# Altium project PieZense_Leader.PrjPcb (part 1 of 3)
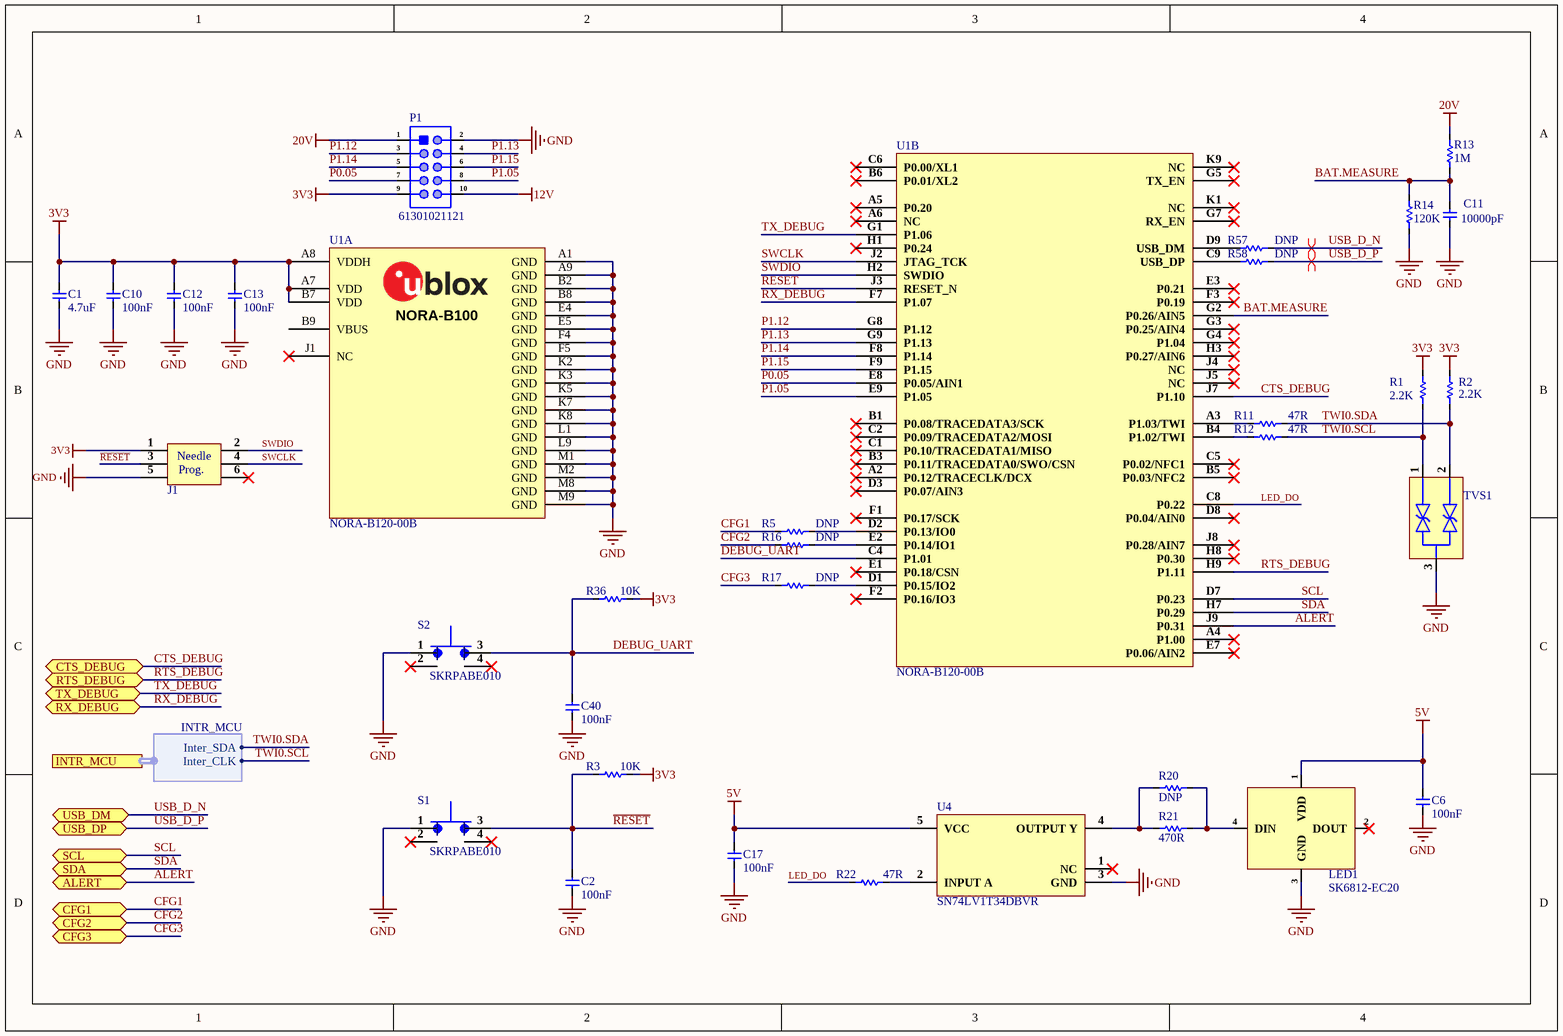
[diagram p0: Piezo_Regulator_Head_MCU.SchDoc]
2 sheets, 136 parts. Net scope: flat (ports and power ports of the same name join across sheets).
Board file: Piezo_Regulator_Head.PcbDoc
Sheets:
  Piezo_Regulator_Head_MCU.SchDoc
  Piezo_Regulator_Head_Power.SchDoc

## Sheet Piezo_Regulator_Head_MCU.SchDoc
size A4; SheetNumber: 1; SheetTotal: 2

### Parts
C1  4.7uF  [Cap-0603]
C2  100nF  [Cap-0603]
C6  100nF  [Cap-0603]
C10  100nF  [Cap-0603]
C11  10000pF  [Cap-0603]
C12  100nF  [Cap-0603]
C13  100nF  [Cap-0603]
C17  100nF  [Cap-0603]
C40  100nF  [Cap-0603]
J1  TC2030-MCP-NL  [TC2030-MCP-NL]  (value not drawn)
LED1  SK6812-EC20  [SK6812-EC20]
P1  61301021121  [HDR 2x5 TH (Male)]
R1  2.2K  [Res-0603]
R2  2.2K  [Res-0603]
R3  10K  [Res-0603]
R5  DNP  [Res-0603]
R11  47R  [Res-0603]
R12  47R  [Res-0603]
R13  1M  [Res-0603]
R14  120K  [Res-0603]
R16  DNP  [Res-0603]
R17  DNP  [Res-0603]
R20  DNP  [Res-0603]
R21  470R  [Res-0603]
R22  47R  [Res-0603]
R36  10K  [Res-0603]
R57  DNP  [Res-0603]
R58  DNP  [Res-0603]
S1  SKRPABE010  [SKRPABE010]
S2  SKRPABE010  [SKRPABE010]
TVS1  NUP2105LT1G  [SOT-23]  (value not drawn)
U1  NORA-B120-00B  [NORA-B120-00B]  (parts A,B of 2)
U4  SN74LV1T34DBVR  [SOT-23-5]

### Ports
ALERT (bidir, see Piezo_Regulator_Head_Power[6D]), CFG1 (bidir, see Piezo_Regulator_Head_Power[6D]), CFG2 (bidir, see Piezo_Regulator_Head_Power[6D]), CFG3 (bidir, see Piezo_Regulator_Head_Power[6D]), CTS_DEBUG (bidir, see Piezo_Regulator_Head_Power[6D]), INTR_MCU (harness INTR_MCU, see Piezo_Regulator_Head_Power[6D]), RTS_DEBUG (bidir, see Piezo_Regulator_Head_Power[6D]), RX_DEBUG (bidir, see Piezo_Regulator_Head_Power[6D]), SCL (bidir, see Piezo_Regulator_Head_Power[6D]), SDA (bidir, see Piezo_Regulator_Head_Power[6D]), TX_DEBUG (bidir, see Piezo_Regulator_Head_Power[6D]), USB_DM (bidir, see Piezo_Regulator_Head_Power[5D]), USB_DP (bidir, see Piezo_Regulator_Head_Power[5D])

### Harnesses
INTR_MCU: Inter_SDA, Inter_CLK

### Nets
3V3: C1.2 C10.2 C12.2 C13.2 J1.1 P1.9 R1.2 R2.2 R3.2 R36.2 U1.A7(VDD) U1.A8(VDDH) U1.B7(VDD)
5V: C6.2 C17.2 LED1.1(VDD) U4.5(VCC)
12V: P1.10
20V: P1.1 R13.2
GND: C1.1 C2.1 C6.1 C10.1 C11.1 C12.1 C13.1 C17.1 C40.1 J1.5 LED1.3(GND) P1.2 R14.1 S1.1 S2.1 TVS1.3 U1.A1(GND) U1.A9(GND) U1.B2(GND) U1.B8(GND) U1.E4(GND) U1.E5(GND) U1.F4(GND) U1.F5(GND) U1.K2(GND) U1.K3(GND) U1.K5(GND) U1.K7(GND) U1.K8(GND) U1.L1(GND) U1.L9(GND) U1.M1(GND) U1.M2(GND) U1.M8(GND) U1.M9(GND) U4.3(GND)
ALERT: U1.J9(P0.31) ; port ALERT
BAT.MEASURE: C11.2 R13.1 R14.2 U1.G2(P0.26/AIN5)
CFG1: R5.1 ; port CFG1
CFG2: R16.1 ; port CFG2
CFG3: R17.1 ; port CFG3
CTS_DEBUG: U1.J7(P1.10) ; port CTS_DEBUG
DEBUG_UART: C40.2 R36.1 S2.3 U1.C4(P1.01)
LED_DO: R22.1 U1.C8(P0.22)
P0.05: P1.7 U1.E8(P0.05/AIN1)
P1.05: P1.8 U1.E9(P1.05)
P1.12: P1.3 U1.G8(P1.12)
P1.13: P1.4 U1.G9(P1.13)
P1.14: P1.5 U1.F8(P1.14)
P1.15: P1.6 U1.F9(P1.15)
~{RESET}: C2.2 J1.3 R3.1 S1.3 U1.J3(RESET_N)
RTS_DEBUG: U1.H9(P1.11) ; port RTS_DEBUG
RX_DEBUG: U1.F7(P1.07) ; port RX_DEBUG
SCL: U1.D7(P0.23) ; port SCL
SDA: U1.H7(P0.29) ; port SDA
SWCLK: J1.4 U1.J2(JTAG_TCK)
SWDIO: J1.2 U1.H2(SWDIO)
TWI0.SCL: R1.1 R12.2 TVS1.1 ; port INTR_MCU.Inter_CLK
TWI0.SDA: R2.1 R11.2 TVS1.2 ; port INTR_MCU.Inter_SDA
TX_DEBUG: U1.G1(P1.06) ; port TX_DEBUG
USB_D_N: R57.2 ; port USB_DM
USB_D_P: R58.2 ; port USB_DP
NetLED1_4: LED1.4(DIN) R20.2 R21.2
NetR5_2: R5.2 U1.D2(P0.13/IO0)
NetR11_1: R11.1 U1.A3(P1.03/TWI)
NetR12_1: R12.1 U1.B4(P1.02/TWI)
NetR16_2: R16.2 U1.E2(P0.14/IO1)
NetR17_2: R17.2 U1.D1(P0.15/IO2)
NetR20_1: R20.1 R21.1 U4.4(OUTPUT_Y)
NetR22_2: R22.2 U4.2(INPUT_A)
NetR57_1: R57.1 U1.D9(USB_DM)
NetR58_1: R58.1 U1.C9(USB_DP)

Not connected (* = marked no-connect by the designer): J1 6*; LED1 2(DOUT)*; S1 2(1)* 4(2)*; S2 2(1)* 4(2)*; U1 A2(P0.12/TRACECLK/DCX)* A4(P1.00)* A5(P0.20)* A6(NC)* B1(P0.08/TRACEDATA3/SCK)* B3(P0.11/TRACEDATA0/SWO/CSN)* B5(P0.03/NFC2)* B6(P0.01/XL2)* B9(VBUS) C1(P0.10/TRACEDATA1/MISO)* C2(P0.09/TRACEDATA2/MOSI)* C5(P0.02/NFC1)* C6(P0.00/XL1)* D3(P0.07/AIN3)* D8(P0.04/AIN0)* E1(P0.18/CSN)* E3(P0.21)* E7(P0.06/AIN2)* F1(P0.17/SCK)* F2(P0.16/IO3)* F3(P0.19)* G3(P0.25/AIN4)* G4(P1.04)* G5(TX_EN)* G7(RX_EN)* H1(P0.24)* H3(P0.27/AIN6)* H8(P0.30)* J1(NC)* J4(NC)* J5(NC)* J8(P0.28/AIN7)* K1(NC)* K9(NC)*; U4 1(NC)*

### Layout directives
differential pair; differential pair class USB_DIF: USB_D_N
differential pair: USB_D_P

### Notes on the sheet
- (in symbol NORA-B120-00B, part A) NORA-B100
- (in symbol TC2030-MCP-NL) Needle; Prog.

### Library data of the parts
C1 = GRM188R6YA475KE15D: CAP CER 4.7UF 35V X5R 0603; Manufacturer: Murata; Manufacturer Lifecycle Status: IN PRODUCTION; Item Type: Capacitors; Value: 4.7µF; Dielectric Material: Ceramic; Tolerance: 10%; Supplier: Arrow Electronics; Supplier Part Number: GRM188R6YA475KE15D; Manufacturer Part Number: GRM188R6YA475KE15D; RoHS: Compliant; Stock: 256000; Pricing: 4000=0.046, 8000=0.039, 24000=0.036 (USD); Case/Package: 0603; Case Code (Imperial): 0603; Case Code (Metric): 1608; Composition: Ceramic; Depth: 800µm; Dielectric: X5R; Height: 800µm; Lead Free: Lead Free; Length: 1.6mm; Lifecycle Status: Production; Material: Ceramic; Max Operating Temperature: 85°C; Min Operating Temperature: -55°C; Mounting Technology: Surface Mount; Number of Terminals: 2; REACH SVHC: Yes; Schedule B: 8532240020, 8532240020|8532240020|8532240020|8532240020|8532240020|8532240020|8532240020|8532240020|8532240020|8532240020|8532240020|8532240020|8532240020|8532240020|8532240020|8532240020|8532240020|8532240020|8532240020|8532240020|8532240020|8532240020|8532240020, 8532240020|8532240020|8532240020|8532240020|8532240020|8532240020|8532240020|8532240020|8532240020|8532240020|8532240020|8532240020|8532240020|8532240020|8532240020|8532240020|8532240020|8532240020|8532240020|8532240020|8532240020|8532240020|8532240020|85; Termination: SMD/SMT; Thickness: 800µm; Voltage: 35V; Voltage Rating: 35V; Voltage Rating (DC): 35V; Weight: 6.293594mg; Width: 800µm; ComponentLink1URL: https://datasheet.octopart.com:443/GRM188R6YA475KE15D-Murata-datasheet-27203393.pdf?src-supplier=Newark; ComponentLink1Description: https://datasheet.octopart.com:443/GRM188R6YA475KE15D-Murata-datasheet-27203393.pdf?src-supplier=Newark; ComponentLink2URL: https://datasheet.octopart.com:443/GRM188R6YA475KE15D-Murata-datasheet-62317201.pdf?src-supplier=element14+APAC; ComponentLink2Description: https://datasheet.octopart.com:443/GRM188R6YA475KE15D-Murata-datasheet-62317201.pdf?src-supplier=element14+APAC; ComponentLink3URL: https://datasheet.octopart.com:443/GRM188R6YA475KE15D-Murata-datasheet-14397410.pdf?src-supplier=Future+Electronics; ComponentLink3Description: https://datasheet.octopart.com:443/GRM188R6YA475KE15D-Murata-datasheet-14397410.pdf?src-supplier=Future+Electronics; ComponentLink4URL: https://datasheet.octopart.com:443/GRM188R6YA475KE15D-Murata-datasheet-165579666.pdf?src-supplier=TME; ComponentLink4Description: https://datasheet.octopart.com:443/GRM188R6YA475KE15D-Murata-datasheet-165579666.pdf?src-supplier=TME; ComponentLink5URL: https://datasheet.octopart.com:443/GRM188R6YA475KE15D-Murata-datasheet-141274968.pdf?src-supplier=Ciiva; ComponentLink5Description: https://datasheet.octopart.com:443/GRM188R6YA475KE15D-Murata-datasheet-141274968.pdf?src-supplier=Ciiva; ComponentLink6URL: https://datasheet.octopart.com:443/GRM188R6YA475KE15D-Murata-datasheet-140705175.pdf?src-supplier=Ciiva; ComponentLink6Description: https://datasheet.octopart.com:443/GRM188R6YA475KE15D-Murata-datasheet-140705175.pdf?src-supplier=Ciiva; ComponentLink7URL: https://datasheet.octopart.com:443/GRM188R6YA475KE15D-Murata-datasheet-138742923.pdf?src-supplier=Ciiva; ComponentLink7Description: https://datasheet.octopart.com:443/GRM188R6YA475KE15D-Murata-datasheet-138742923.pdf?src-supplier=Ciiva; ComponentLink8URL: https://datasheet.octopart.com/GRM188R6YA475KE15D-Murata-datasheet-12515295.pdf; ComponentLink8Description: https://datasheet.octopart.com/GRM188R6YA475KE15D-Murata-datasheet-12515295.pdf; ComponentLink9URL: https://datasheet.octopart.com/GRM188R6YA475KE15D-Murata-datasheet-12510076.pdf; ComponentLink9Description: https://datasheet.octopart.com/GRM188R6YA475KE15D-Murata-datasheet-12510076.pdf; ComponentLink10URL: https://datasheet.octopart.com/GRM188R6YA475KE15D-Murata-datasheet-11978611.pdf; ComponentLink10Description: https://datasheet.octopart.com/GRM188R6YA475KE15D-Murata-datasheet-11978611.pdf; ComponentLink11URL: https://datasheet.octopart.com/GRM188R6YA475KE15D-Murata-datasheet-10025737.pdf; ComponentLink11Description: https://datasheet.octopart.com/GRM188R6YA475KE15D-Murata-datasheet-10025737.pdf; ComponentLink12URL: https://datasheet.octopart.com/GRM188R6YA475KE15D-Murata-datasheet-8819587.pdf; ComponentLink12Description: https://datasheet.octopart.com/GRM188R6YA475KE15D-Murata-datasheet-8819587.pdf; ComponentLink13URL: https://datasheet.octopart.com:443/GRM188R6YA475KE15D-Murata-datasheet-150009168.pdf?src-supplier=Arrow.cn; ComponentLink13Description: https://datasheet.octopart.com:443/GRM188R6YA475KE15D-Murata-datasheet-150009168.pdf?src-supplier=Arrow.cn; ComponentLink14URL: http://sigma.octopart.com:80/reach_statement/Murata-company-16.pdf?src-supplier=Compliance+Statements; ComponentLink14Description: http://sigma.octopart.com:80/reach_statement/Murata-company-16.pdf?src-supplier=Compliance+Statements
C2 C6 C10 C12 C13 C17 C40 = CC0603KRX5R9BB104: CAP CER 0.1UF 50V X5R 0603; Manufacturer: Yageo; Tolerance: 10%; Item Type: Capacitor; Supplier 1: Digi-Key; Manufacturer Part Number: CC0603KRX5R9BB104; RoHS: Yes; Category: Ceramic Capacitors; Stock 1: 152253; Pricing 1: 1=0.10000, 10=0.05200, 50=0.02820, 100=0.02310, 500=0.01648, 1000=0.01294 (USD); Mount: Surface Mount; Case/Package: 0603; Case Code (Imperial): 0603; Case Code (Metric): 1608; Weight: 7.1E-05oz; Min Operating Temperature: -55°C; Max Operating Temperature: 85°C; Capacitance: 100nF; Packaging: Tape and Reel; Voltage Rating: 50V; Dielectric: X5R; Termination: SMD/SMT; Voltage Rating (DC): 50V; Package Quantity: 4000; Length: 0.063inch; Width: 0.031inch; Thickness: 0.035inch; Lead Free: Lead Free; Halogen Free: Halogen Free; ComponentLink1URL: http://www.mouser.com/ds/2/447/Yageo_UPY-GP_NP0_16V-to-50V_9-358835.pdf?src-supplier=Mouser; ComponentLink1Description: http://www.mouser.com/ds/2/447/Yageo_UPY-GP_NP0_16V-to-50V_9-358835.pdf?src-supplier=Mouser; ComponentLink2URL: https://www.yageo.com/upload/media/product/productsearch/datasheet/mlcc/UPY-GPHC_X5R_4V-to-50V_26.pdf?src-supplier=Digi-Key; ComponentLink2Description: https://www.yageo.com/upload/media/product/productsearch/datasheet/mlcc/UPY-GPHC_X5R_4V-to-50V_26.pdf?src-supplier=Digi-Key; ComponentLink3URL: http://www.yageo.com/exep/pages/download/literatures/ProductSelectionGuide%202014_Final_2.pdf?src-supplier=Digi-Key; ComponentLink3Description: http://www.yageo.com/exep/pages/download/literatures/ProductSelectionGuide%202014_Final_2.pdf?src-supplier=Digi-Key; Supplier Part Number 1: 311-4046-1-ND; LCSC Part Number: C110022
C11 = CC0603KRX7R9BB103: CAP CER 10000PF 50V X7R 0603; Manufacturer: Yageo; Material: Ceramic; Tolerance: 10%; Capacitance: 10nF; Insulation Resistance: 100GR; Supplier 1: Digi-Key; Manufacturer Part Number: CC0603KRX7R9BB103; Stock 1: 8411467; Pricing 1: 1=0.1, 10=0.038, 100=0.0171, 500=0.01224, 1000=0.00962 (USD); Mount: Surface Mount; Case/Package: 0603; Number of Pins: 2; Case Code (Metric): 1608; Case Code (Imperial): 0603; Min Operating Temperature: -55°C; Max Operating Temperature: 125°C; Dielectric: X7R; Voltage: 50V; Packaging: Tape and Reel; Voltage Rating: 50V; Voltage Rating (DC): 50V; Package Quantity: 1; Termination: SMD/SMT; Composition: Ceramic; Length: 1.6mm; Height: 0.8mm; Width: 0.031inch; Thickness: 0.035inch; Depth: 0.8mm; Radiation Hardening: No; REACH SVHC: No SVHC; Lead Free: Lead Free; Halogen Free: Halogen Free; ComponentLink1URL: http://www.farnell.com/datasheets/1734573.pdf?src-supplier=Element14; ComponentLink1Description: http://www.farnell.com/datasheets/1734573.pdf?src-supplier=Element14; ComponentLink2URL: http://www.yageo.com/documents/recent/UPY-GPHC_X7R_6.3V-to-50V_18.pdf?src-supplier=Digi-Key; ComponentLink2Description: http://www.yageo.com/documents/recent/UPY-GPHC_X7R_6.3V-to-50V_18.pdf?src-supplier=Digi-Key; ComponentLink3URL: http://www.farnell.com/datasheets/2167236.pdf?src-supplier=Mouser; ComponentLink3Description: http://www.farnell.com/datasheets/2167236.pdf?src-supplier=Mouser; ComponentLink4URL: http://www.farnell.com/datasheets/70765.pdf?src-supplier=Element14; ComponentLink4Description: http://www.farnell.com/datasheets/70765.pdf?src-supplier=Element14; ComponentLink5URL: http://www.yageo.com/documents/recent/UPY-GPHC_X7R_6.3V-to-50V_8.pdf?src-supplier=Avnet+Europe; ComponentLink5Description: http://www.yageo.com/documents/recent/UPY-GPHC_X7R_6.3V-to-50V_8.pdf?src-supplier=Avnet+Europe; ComponentLink6URL: http://www.farnell.com/datasheets/1489800.pdf?src-supplier=Element14; ComponentLink6Description: http://www.farnell.com/datasheets/1489800.pdf?src-supplier=Element14; ComponentLink7URL: https://www.verical.com/server-webapp/html/getDatasheet?partID=403582&src-supplier=Verical; ComponentLink7Description: https://www.verical.com/server-webapp/html/getDatasheet?partID=403582&src-supplier=Verical; Supplier Part Number 1: 311-1085-6-ND; LCSC Part Number: C100042
J1 = TC2030-MCP-NL: PLUG-OF-NAILS 6-PIN W/O LEGS; Manufacturer: Tag-Connect; Item Type: Cables and Wire; Number of Contacts: 6; Shielding: No; Supplier: DigiKey; Supplier Part Number: TC2030-MCP-NLTC-ND; Manufacturer Part Number: TC2030-MCP-NL; RoHS: Compliant; Stock: 740; Pricing: 1=36 (USD); Lead Free: Lead Free; REACH SVHC: No; ComponentLink1URL: https://datasheet.octopart.com:443/TC2030-MCP-NL-Tag-Connect-datasheet-181254555.pdf?src-supplier=IHS; ComponentLink1Description: https://datasheet.octopart.com:443/TC2030-MCP-NL-Tag-Connect-datasheet-181254555.pdf?src-supplier=IHS; ComponentLink2URL: https://datasheet.octopart.com:443/TC2030-MCP-NL-Tag-Connect-datasheet-17049191.pdf?src-supplier=Factory+Futures; ComponentLink2Description: https://datasheet.octopart.com:443/TC2030-MCP-NL-Tag-Connect-datasheet-17049191.pdf?src-supplier=Factory+Futures
LED1 = SK6812-EC20: 5mA -40℃~+80℃ RGB SMD,2x2mm Light Emitting Diodes (LED) ROHS; Manufacturer: OPSCO Optoelectronics; Item Type: RGB LED; Manufacturer Part Number: SK6812-EC20; Package: SMD,2x2mm; LCSC Part Number: C2909058; ComponentLink1Description: LCSC; ComponentLink1URL: https://www.lcsc.com/product-detail/Light-Emitting-Diodes-LED_OPSCO-Optoelectronics-SK6812-EC20_C2909058.html
P1 = 61301021121: CONN HEADER VERT 10POS 2.54MM; Manufacturer: Wurth Elektronik; Item Type: Headers and Wire Housings; Connector Type: Male Pin; Contact Resistance: 20mΩ; Current Rating: 3A; Gender: Male; Insulation: Insulated; Insulation Resistance: 1GΩ; Number of Contacts: 10; Operating Supply Voltage: 250V; Supplier: DigiKey; Supplier Part Number: 732-2672-ND; Manufacturer Part Number: 61301021121; RoHS: Compliant; Stock: 6292; Pricing: 1=1, 10=0.978, 50=0.9028, 100=0.8271, 250=0.75152 (USD); Color: Black; Contact Gender: Male; Contact Material: Gold; Contact Mating Length: 5.9944mm; Contact Plating: Gold; Flammability Rating: UL94 V-0; Height: 8.89mm; Housing Material: PBT; Lead Pitch: 2.54mm; Length: 12.7mm; Max Operating Temperature: 105°C; Min Operating Temperature: -40°C; Mounting Technology: Through Hole; Pins: 10; Number of Positions: 10; Number of Rows: 2; Orientation: Vertical; Packaging: Bulk; Pitch: 2.54mm; Row Spacing: 2.54mm; Termination: Through Hole; Voltage Rating: 250V; Width: 12.7mm; ComponentLink1URL: https://datasheet.octopart.com:443/61301021121-W%C3%BCrth-Elektronik-datasheet-45185731.pdf?src-supplier=Upverter; ComponentLink1Description: https://datasheet.octopart.com:443/61301021121-W%C3%BCrth-Elektronik-datasheet-45185731.pdf?src-supplier=Upverter; ComponentLink2URL: https://datasheet.octopart.com:443/61301021121-W%C3%BCrth-Elektronik-datasheet-149524113.pdf?src-supplier=Future+Electronics; ComponentLink2Description: https://datasheet.octopart.com:443/61301021121-W%C3%BCrth-Elektronik-datasheet-149524113.pdf?src-supplier=Future+Electronics; ComponentLink3URL: https://datasheet.octopart.com:443/61301021121-W%C3%BCrth-Elektronik-Midcom-datasheet-10693404.pdf?src-supplier=element14+APAC; ComponentLink3Description: https://datasheet.octopart.com:443/61301021121-W%C3%BCrth-Elektronik-Midcom-datasheet-10693404.pdf?src-supplier=element14+APAC
R1 R2 = RC0603FR-072K2L: RES 2.2K OHM 1% 1/10W 0603; Manufacturer: Yageo; Resistance: 2.2kR; Temperature Coefficient: 100ppm/°C; Power Rating: 100mW; Voltage Rating: 50V; Item Type: Resistor; Supplier 1: Avnet; Manufacturer Part Number: RC0603FR-072K2L; RoHS: Yes; Category: Chip SMD Resistors; Stock 1: 733100; Pricing 1: 5000=0.00133, 10000=0.00131, 20000=0.00127 (USD); Case/Package: 0603; Case Code (Imperial): 0603; Case Code (Metric): 1608; Size Code: 0603; Min Operating Temperature: -55°C; Max Operating Temperature: 155°C; Tolerance: 1%; Packaging: Tape and Reel; Resistor Type: Thick Film; Package Quantity: 1; Termination: SMD/SMT; Number of Terminations: 2; Max Power Dissipation: 100mW; Features: Moisture Resistant; Series: RC; Resistance Tolerance: 1%; Construction: Rectangular; Length: 1.6mm; Width: 0.031inch; Height: 0.022inch; Depth: 0.8mm; Lead Free: Lead Free; Military Standard: Not; RoHS Compliant: Yes; Supplier Part Number 1: RC0603FR-072K2L; LCSC Part Number: C114662
R3 R36 = RC0603FR-0710KL: RES SMD 10K Ohm 1% 1/10W 0603; Manufacturer: Yageo; Resistance: 10kR; Temperature Coefficient: 100ppm/°C; Voltage Rating (DC): 50V; Power Rating: 100mW; Voltage Rating: 75V; Item Type: Resistor; Supplier 1: Digi-Key; Manufacturer Part Number: RC0603FR-0710KL; RoHS: Yes; Category: Chip SMD Resistors; Stock 1: 25249139; Pricing 1: 1=0.10000, 10=0.02400, 100=0.00970, 1000=0.00436, 2500=0.00378 (USD); Case/Package: 0603; Number of Pins: 2; Case Code (Imperial): 0603; Case Code (Metric): 1608; Weight: 7.1E-05oz; Size Code: 0603; Min Operating Temperature: -55°C; Max Operating Temperature: 155°C; Tolerance: 1%; Resistor Type: Thick Film; Packaging: Tape and Reel; Termination: SMD/SMT; Features: Moisture Resistant; Series: RC; Max Power Dissipation: 100mW; Number of Terminations: 2; Resistance Tolerance: 1%; Construction: Rectangular; Length: 1.6mm; Width: 0.8mm; Height: 0.45mm; Depth: 0.8mm; Lead Pitch: 0.3mm; REACH SVHC: Unknown; Lead Free: Lead Free; Military Standard: Not; RoHS Compliant: Yes; ComponentLink1URL: https://datasheet.ciiva.com/7660/38590-7660789.pdf?src-supplier=Element14; ComponentLink1Description: https://datasheet.ciiva.com/7660/38590-7660789.pdf?src-supplier=Element14; ComponentLink2URL: https://datasheet.ciiva.com/7983/443971-7983596.pdf?src-supplier=Element14; ComponentLink2Description: https://datasheet.ciiva.com/7983/443971-7983596.pdf?src-supplier=Element14; ComponentLink3URL: https://datasheet.ciiva.com/22747/443971-22747519.pdf?src-supplier=Element14; ComponentLink3Description: https://datasheet.ciiva.com/22747/443971-22747519.pdf?src-supplier=Element14; ComponentLink4URL: https://datasheet.ciiva.com/46440/1868787-46440891.pdf?src-supplier=Element14; ComponentLink4Description: https://datasheet.ciiva.com/46440/1868787-46440891.pdf?src-supplier=Element14; ComponentLink5URL: https://datasheet.ciiva.com/7746/1738695-7746239.pdf?src-supplier=Element14; ComponentLink5Description: https://datasheet.ciiva.com/7746/1738695-7746239.pdf?src-supplier=Element14; ComponentLink6URL: https://datasheet.ciiva.com/15189/getdatasheetpartid-409289-15189591.pdf?src-supplier=Verical; ComponentLink6Description: https://datasheet.ciiva.com/15189/getdatasheetpartid-409289-15189591.pdf?src-supplier=Verical; Supplier Part Number 1: 311-10.0KHRCT-ND; LCSC Part Number: C98220
R5 R16 R17 R20 R57 R58 = RC0603JR-070RL: RES 0 OHM JUMPER 1/10W 0603; Manufacturer: Yageo; Resistance: 0mR; Tolerance: 1%; Power Rating: 100mW; Voltage Rating (DC): 50V; Temperature Coefficient: 200ppm/°C; Resistance Tolerance: 5%; Item Type: Resistor; Supplier 1: Digi-Key; Manufacturer Part Number: RC0603JR-070RL; RoHS: Yes; Category: Chip SMD Resistors; Stock 1: 18081776; Pricing 1: 1=0.10000, 10=0.01700, 25=0.01240, 50=0.00960, 100=0.00700, 250=0.00536, 500=0.00430, 1000=0.00316 (USD); Case/Package: 0603; Number of Pins: 2; Contact Plating: Tin,Matte; Case Code (Imperial): 0603; Case Code (Metric): 1608; Size Code: 0603; Min Operating Temperature: -55°C; Max Operating Temperature: 155°C; Resistor Type: Thick Film; Packaging: Tape and Reel; Termination: SMD/SMT; Series: RC; Technology: THICK FILM; Package Quantity: 5000; Voltage Rating: 50V; Features: Moisture Resistant; Max Power Dissipation: 100mW; Number of Terminations: 2; Construction: Rectangular; Length: 1.6mm; Width: 0.8mm; Height: 0.45mm; Depth: 0.8mm; Radiation Hardening: No; Reach SVHC Compliant: No SVHC; Lead Free: Lead Free; RoHS Compliant: Yes; Military Standard: Not; Supplier Part Number 1: 311-0.0GRCT-ND; LCSC Part Number: C95177
R11 R12 R22 = RC0603FR-0747RL: RES SMD 47OHM 0.1W 0603; Manufacturer: Yageo; Tolerance: 1%; Power Rating: 100mW; Voltage Rating (DC): 50V; Temperature Coefficient: 100ppm/°C; Voltage Rating: 75V; Supplier 1: Digi-Key; Manufacturer Part Number: RC0603FR-0747RL; RoHS: Yes; Category: Chip SMD Resistors; Stock 1: 596562; Pricing 1: 1=0.10000, 10=0.02400, 100=0.00970, 1000=0.00436, 2500=0.00378 (USD); Case/Package: 0603; Number of Pins: 2; Case Code (Imperial): 0603; Case Code (Metric): 1608; Weight: 7.1E-05oz; Size Code: 0603; Min Operating Temperature: -55°C; Max Operating Temperature: 155°C; Resistance: 47R; Packaging: Tape and Reel; Package Quantity: 1; Termination: SMD/SMT; Resistor Type: Thick Film; Number of Terminations: 2; Max Power Dissipation: 100mW; Features: Moisture Resistant; Series: RC; Construction: Rectangular; Resistance Tolerance: 1%; Length: 1.6mm; Width: 0.8mm; Height: 0.022inch; Depth: 0.8mm; REACH SVHC: Unknown; Lead Free: Lead Free; Military Standard: Not; RoHS Compliant: Yes; ComponentLink1URL: https://datasheet.ciiva.com/2453/pyu-r-int-thick-7-2453922.pdf?src-supplier=Digi-Key; ComponentLink1Description: https://datasheet.ciiva.com/2453/pyu-r-int-thick-7-2453922.pdf?src-supplier=Digi-Key; ComponentLink2URL: https://datasheet.ciiva.com/2453/pyu-r-int-thick-7-2453923.pdf?src-supplier=Digi-Key; ComponentLink2Description: https://datasheet.ciiva.com/2453/pyu-r-int-thick-7-2453923.pdf?src-supplier=Digi-Key; ComponentLink3URL: https://datasheet.ciiva.com/2453/pyu-r-int-thick-7-2453924.pdf?src-supplier=Digi-Key; ComponentLink3Description: https://datasheet.ciiva.com/2453/pyu-r-int-thick-7-2453924.pdf?src-supplier=Digi-Key; ComponentLink4URL: https://datasheet.ciiva.com/7746/443971-7746363.pdf?src-supplier=Element14; ComponentLink4Description: https://datasheet.ciiva.com/7746/443971-7746363.pdf?src-supplier=Element14; ComponentLink5URL: https://datasheet.ciiva.com/7746/443971-7746364.pdf?src-supplier=Element14; ComponentLink5Description: https://datasheet.ciiva.com/7746/443971-7746364.pdf?src-supplier=Element14; ComponentLink6URL: https://datasheet.ciiva.com/46440/1868787-46440908.pdf?src-supplier=Element14; ComponentLink6Description: https://datasheet.ciiva.com/46440/1868787-46440908.pdf?src-supplier=Element14; Supplier Part Number 1: 311-47.0HRCT-ND; LCSC Part Number: C114623
R13 = RC0603FR-071ML: RES SMD 1M OHM 1% 1/10W 0603; Manufacturer: Yageo; Voltage Rating: 50V; Resistance: 1MR; Power Rating: 100mW; Temperature Coefficient: 100ppm/°C; Item Type: Resistor; Supplier 1: Digi-Key; Manufacturer Part Number: RC0603FR-071ML; Stock 1: 3824601; Pricing 1: 1=0.1, 10=0.023, 100=0.0094, 1000=0.00421, 2500=0.00366 (USD); Case/Package: 0603; Number of Pins: 2; Case Code (Imperial): 0603; Case Code (Metric): 1608; Min Operating Temperature: -55°C; Max Operating Temperature: 155°C; Voltage Rating (DC): 50V; Tolerance: 1%; Packaging: Tape and Reel; Package Quantity: 5000; Termination: SMD/SMT; Composition: Thick Film; Military Standard: Not; Length: 1.6mm; Height: 0.45mm; Width: 0.8mm; Depth: 0.8mm; REACH SVHC: No SVHC; Lead Free: Lead Free; ComponentLink1URL: http://www.farnell.com/datasheets/2167052.pdf?src-supplier=Mouser; ComponentLink1Description: http://www.farnell.com/datasheets/2167052.pdf?src-supplier=Mouser; ComponentLink2URL: http://www.farnell.com/datasheets/2167052.pdf?src-supplier=Element14; ComponentLink2Description: http://www.farnell.com/datasheets/2167052.pdf?src-supplier=Element14; ComponentLink3URL: http://documents.rs-components.com/techlib://itc_doclist_GB.htm?stockno=5048956&src-supplier=RSComponents; ComponentLink3Description: http://documents.rs-components.com/techlib://itc_doclist_GB.htm?stockno=5048956&src-supplier=RSComponents; Supplier Part Number 1: 311-1.00MHRDKR-ND; LCSC Part Number: C105578
R14 = RC0603FR-07120KL: RES 120K OHM 1% 1/10W 0603; Manufacturer: Yageo; Item Type: Resistors; Value: 120kR; Power Rating: 100mW; Voltage Rating: 50V; Temperature Coefficient: 100ppm/°C; Working Voltage: 75V; Supplier: Future Electronics; LCSC Part Number: C114607; Manufacturer Part Number: RC0603FR-07120KL; RoHS: Yes; Stock: 3405000; Pricing: 5000=0.0022, 50000=0.0021, 150000=0.0021, 375000=0.002, 1000000=0.0019 (USD); Case/Package: 0603; Pins: 2; Case Code (Metric): 1608; Case Code (Imperial): 0603; Min Operating Temperature: -55°C; Max Operating Temperature: 155°C; Tolerance: 1%; Resistor Type: Thick Film; Voltage Rating (DC): 50V; Package Quantity: 5000; Packaging: Tape and Reel; Number of Terminations: 2; Termination: SMD/SMT; Max Power Dissipation: 100mW; Features: Moisture Resistant; Series: RC; Resistance Tolerance: 1%; Technology: THICK FILM; Voltage Rating (AC): 50V; Length: 0.063inch; Width: 0.031inch; Height: 0.022inch; Depth: 0.8mm; Lead Pitch: 2.54mm; Radiation Hardening: 5898YesNo; RoHS Compliant: Yes; Reach SVHC Compliant: Unknown; Lead Free: 5697LeadFree; ComponentLink1URL: https://datasheet.ciiva.com/11808/0900766b80f96399-11808757.pdf?src-supplier=Rs; ComponentLink1Description: https://datasheet.ciiva.com/11808/0900766b80f96399-11808757.pdf?src-supplier=Rs; ComponentLink2URL: https://datasheet.ciiva.com/2454/pyu-r-int-thick-7-2454739.pdf?src-supplier=Digikey; ComponentLink2Description: https://datasheet.ciiva.com/2454/pyu-r-int-thick-7-2454739.pdf?src-supplier=Digikey; ComponentLink3URL: https://datasheet.ciiva.com/2454/pyu-r-int-thick-7-2454740.pdf?src-supplier=Digikey; ComponentLink3Description: https://datasheet.ciiva.com/2454/pyu-r-int-thick-7-2454740.pdf?src-supplier=Digikey; ComponentLink4URL: https://datasheet.ciiva.com/2454/pyu-r-int-thick-7-2454738.pdf?src-supplier=Digikey; ComponentLink4Description: https://datasheet.ciiva.com/2454/pyu-r-int-thick-7-2454738.pdf?src-supplier=Digikey; ComponentLink5URL: https://datasheet.ciiva.com/7746/443971-7746247.pdf?src-supplier=Element14; ComponentLink5Description: https://datasheet.ciiva.com/7746/443971-7746247.pdf?src-supplier=Element14; ComponentLink6URL: https://datasheet.ciiva.com/7746/443971-7746246.pdf?src-supplier=Element14; ComponentLink6Description: https://datasheet.ciiva.com/7746/443971-7746246.pdf?src-supplier=Element14
R21 = RC0603FR-07470RL: RES 470 OHM 1% 1/10W 0603; Manufacturer: Yageo; Power Rating: 100mW; Voltage Rating: 50V; Temperature Coefficient: 100ppm/°C; Working Voltage: 75V; Supplier 1: Digi-Key; Manufacturer Part Number: RC0603FR-07470RL; RoHS: Yes; Category: Chip SMD Resistors; Stock 1: 154083; Pricing 1: 1=0.10000, 10=0.02400, 100=0.00970, 1000=0.00436, 2500=0.00378 (USD); Case/Package: 0603; Case Code (Metric): 1608; Case Code (Imperial): 0603; Min Operating Temperature: -55°C; Max Operating Temperature: 155°C; Tolerance: 1%; Resistance: 470R; Packaging: Tape and Reel; Package Quantity: 1; Resistor Type: Thick Film; Number of Terminations: 2; Termination: SMD/SMT; Max Power Dissipation: 100mW; Features: Moisture Resistant; Series: RC; Technology: THICK FILM; Resistance Tolerance: 1%; Construction: Rectangular; Length: 1.6mm; Width: 0.031inch; Height: 0.022inch; Depth: 0.8mm; RoHS Compliant: Yes; REACH SVHC: No SVHC; Military Standard: Not; Lead Free: Lead Free; ComponentLink1URL: https://datasheet.ciiva.com/11808/0900766b80f96399-11808177.pdf?src-supplier=RSComponents; ComponentLink1Description: https://datasheet.ciiva.com/11808/0900766b80f96399-11808177.pdf?src-supplier=RSComponents; ComponentLink2URL: https://datasheet.ciiva.com/7746/1738695-7746359.pdf?src-supplier=Element14; ComponentLink2Description: https://datasheet.ciiva.com/7746/1738695-7746359.pdf?src-supplier=Element14; ComponentLink3URL: https://datasheet.ciiva.com/7746/1738695-7746360.pdf?src-supplier=Element14; ComponentLink3Description: https://datasheet.ciiva.com/7746/1738695-7746360.pdf?src-supplier=Element14; ComponentLink4URL: https://datasheet.ciiva.com/7660/1868787-7660793.pdf?src-supplier=Element14; ComponentLink4Description: https://datasheet.ciiva.com/7660/1868787-7660793.pdf?src-supplier=Element14; ComponentLink5URL: https://datasheet.ciiva.com/46440/1868787-46440907.pdf?src-supplier=Element14; ComponentLink5Description: https://datasheet.ciiva.com/46440/1868787-46440907.pdf?src-supplier=Element14; ComponentLink6URL: https://datasheet.ciiva.com/2454/pyu-r-int-thick-7-2454012.pdf?src-supplier=Digi-Key; ComponentLink6Description: https://datasheet.ciiva.com/2454/pyu-r-int-thick-7-2454012.pdf?src-supplier=Digi-Key; ComponentLink7URL: https://datasheet.ciiva.com/2454/pyu-r-int-thick-7-2454013.pdf?src-supplier=Digi-Key; ComponentLink7Description: https://datasheet.ciiva.com/2454/pyu-r-int-thick-7-2454013.pdf?src-supplier=Digi-Key; ComponentLink8URL: https://datasheet.ciiva.com/2454/pyu-r-int-thick-7-2454014.pdf?src-supplier=Digi-Key; ComponentLink8Description: https://datasheet.ciiva.com/2454/pyu-r-int-thick-7-2454014.pdf?src-supplier=Digi-Key; Supplier Part Number 1: 311-470HRCT-ND; LCSC Part Number: C114669
S1 S2 = SKRPABE010: SWITCH TACTILE SPST-NO 0.05A 16V; Manufacturer: ALPS; Item Type: Tactile Switches; Actuator Length: 711.2µm; Contact Current Rating: 50mA; Contact Resistance: 500mΩ; Electrical Life: 100kcycles; Insulation Resistance: 100MΩ; Number of Positions: 1; Operating Force: 1.57N; Throw Configuration: SPST; Supplier: DigiKey; Supplier Part Number: 4809-SKRPABE010CT-ND; Manufacturer Part Number: SKRPABE010; RoHS: Compliant; Stock: 35807; Pricing: 1=0.21, 10=0.179, 25=0.1684, 100=0.1511, 250=0.14016, 500=0.13228, 1000=0.12484 (USD); Case/Package: SMD/SMT; Color: Clear; Contact Plating: Silver; Current Rating: 50mA; Depth: 4.6mm; Height: 1.8034mm; Lead Free: Lead Free; Length: 4.191mm; Life (Cycles): 100kcycles; Lifecycle Status: Production; Max Current Rating: 50mA; Max Operating Temperature: 85°C; Max Voltage Rating (DC): 16V; Min Operating Temperature: -30°C; Mounting Technology: Surface Mount; Orientation: Straight; Radiation Hardening: No; Termination: J-Bend; Voltage Rating (DC): 16V; ComponentLink1URL: https://datasheet.octopart.com:443/SKRPABE010-ALPS-datasheet-182234810.pdf?src-supplier=IHS; ComponentLink1Description: https://datasheet.octopart.com:443/SKRPABE010-ALPS-datasheet-182234810.pdf?src-supplier=IHS; ComponentLink2URL: https://datasheet.octopart.com:443/SKRPABE010-ALPS-datasheet-182235266.pdf?src-supplier=IHS; ComponentLink2Description: https://datasheet.octopart.com:443/SKRPABE010-ALPS-datasheet-182235266.pdf?src-supplier=IHS; ComponentLink3URL: https://datasheet.octopart.com:443/SKRPABE010-ALPS-datasheet-41327040.pdf?src-supplier=Master+Electronics; ComponentLink3Description: https://datasheet.octopart.com:443/SKRPABE010-ALPS-datasheet-41327040.pdf?src-supplier=Master+Electronics; ComponentLink4URL: https://datasheet.octopart.com:443/SKRPABE010-ALPS-datasheet-138899521.pdf?src-supplier=TME; ComponentLink4Description: https://datasheet.octopart.com:443/SKRPABE010-ALPS-datasheet-138899521.pdf?src-supplier=TME; ComponentLink5URL: https://datasheet.octopart.com:443/SKRPABE010-ALPS-datasheet-37145204.pdf?src-supplier=Electro+Sonic; ComponentLink5Description: https://datasheet.octopart.com:443/SKRPABE010-ALPS-datasheet-37145204.pdf?src-supplier=Electro+Sonic
TVS1 = NUP2105LT1G: TVS DIODE 24VWM 44VC SOT233; Manufacturer: onsemi; Manufacturer Lifecycle Status: ACTIVE; Item Type: TVS Diodes; Breakdown Voltage: 29.1V; Value: 30pF; Clamping Voltage: 44V; Direction: Bidirectional; Element Configuration: Dual; ESD Protection: Yes; Leakage Current: 100nA; Max Breakdown Voltage: 32V; Max Power Dissipation: 350W; Max Surge Current: 8A; Min Breakdown Voltage: 26.2V; Number of Bidirectional Channels: 2; Operating Supply Voltage: 24V; Power Line Protection: No; Test Current: 1mA; Supplier: Arrow Electronics; LCSC Part Number: C14486; Manufacturer Part Number: NUP2105LT1G; RoHS: Compliant; Stock: 2046000; Pricing: 3000=0.0671 (USD); Case/Package: SOT-23; China RoHS: Compliant; Composition: Zener; Contact Plating: Tin; Depth: 1.3mm; Halogen Free: Halogen Free; Height: 940µm; Lead Free: Lead Free; Length: 2.9mm; Lifecycle Status: Production; Max Operating Temperature: 150°C; Max Reverse Leakage Current: 100nA; Min Operating Temperature: -55°C; Number of Channels: 2; Number of Elements: 2; Number of Lines: 2; Pins: 3; Number of Terminals: 3; Packaging: Tape and Reel; Peak Pulse Current: 8A; Peak Pulse Power: 350W; Peak Reverse Current: 100nA; Polarity: Bidirectional; Radiation Hardening: No; REACH SVHC: Yes; Reverse Standoff Voltage: 24V; Termination: SMD/SMT; Width: 1.3mm; Working Voltage: 24V; ComponentLink1URL: https://datasheet.octopart.com:443/NUP2105LT1G-onsemi-datasheet-180968600.pdf?src-supplier=IHS; ComponentLink1Description: https://datasheet.octopart.com:443/NUP2105LT1G-onsemi-datasheet-180968600.pdf?src-supplier=IHS; ComponentLink2URL: https://datasheet.octopart.com:443/NUP2105LT1G-ON-Semiconductor-datasheet-141916699.pdf?src-supplier=Upverter; ComponentLink2Description: https://datasheet.octopart.com:443/NUP2105LT1G-ON-Semiconductor-datasheet-141916699.pdf?src-supplier=Upverter; ComponentLink3URL: https://datasheet.octopart.com:443/NUP2105LT1G-ON-Semiconductor-datasheet-138898254.pdf?src-supplier=onsemi; ComponentLink3Description: https://datasheet.octopart.com:443/NUP2105LT1G-ON-Semiconductor-datasheet-138898254.pdf?src-supplier=onsemi; ComponentLink4URL: https://datasheet.octopart.com:443/NUP2105LT1G-ON-Semiconductor-datasheet-8329749.pdf?src-supplier=element14+APAC; ComponentLink4Description: https://datasheet.octopart.com:443/NUP2105LT1G-ON-Semiconductor-datasheet-8329749.pdf?src-supplier=element14+APAC; ComponentLink5URL: https://datasheet.octopart.com:443/NUP2105LT1G-onsemi-datasheet-163746571.pdf?src-supplier=element14+APAC; ComponentLink5Description: https://datasheet.octopart.com:443/NUP2105LT1G-onsemi-datasheet-163746571.pdf?src-supplier=element14+APAC; ComponentLink6URL: https://datasheet.octopart.com:443/NUP2105LT1G-ON-Semiconductor-datasheet-62289975.pdf?src-supplier=RS+(Formerly+Allied+Electronics); ComponentLink6Description: https://datasheet.octopart.com:443/NUP2105LT1G-ON-Semiconductor-datasheet-62289975.pdf?src-supplier=RS+(Formerly+Allied+Electronics); ComponentLink7URL: https://datasheet.octopart.com:443/NUP2105LT1G-ON-Semiconductor-datasheet-10979798.pdf?src-supplier=TME; ComponentLink7Description: https://datasheet.octopart.com:443/NUP2105LT1G-ON-Semiconductor-datasheet-10979798.pdf?src-supplier=TME; ComponentLink8URL: https://datasheet.octopart.com:443/NUP2105LT1G-onsemi-datasheet-157205202.pdf?src-supplier=TME; ComponentLink8Description: https://datasheet.octopart.com:443/NUP2105LT1G-onsemi-datasheet-157205202.pdf?src-supplier=TME; ComponentLink9URL: https://datasheet.octopart.com:443/NUP2105LT1G-onsemi-datasheet-38906.pdf?src-supplier=Master+Electronics; ComponentLink9Description: https://datasheet.octopart.com:443/NUP2105LT1G-onsemi-datasheet-38906.pdf?src-supplier=Master+Electronics; ComponentLink10URL: https://datasheet.octopart.com:443/NUP2105LT1G.-ON-Semiconductor-datasheet-94100686.pdf?src-supplier=Newark; ComponentLink10Description: https://datasheet.octopart.com:443/NUP2105LT1G.-ON-Semiconductor-datasheet-94100686.pdf?src-supplier=Newark; ComponentLink11URL: https://datasheet.octopart.com:443/NUP2105LT1G-ON-Semiconductor-datasheet-14047665.pdf?src-supplier=iiiC; ComponentLink11Description: https://datasheet.octopart.com:443/NUP2105LT1G-ON-Semiconductor-datasheet-14047665.pdf?src-supplier=iiiC; ComponentLink12URL: http://sigma.octopart.com:80/15540786/rohs_certificate/ON-Semiconductor-NUP2105LT1G.pdf?src-supplier=Compliance+Statements; ComponentLink12Description: http://sigma.octopart.com:80/15540786/rohs_certificate/ON-Semiconductor-NUP2105LT1G.pdf?src-supplier=Compliance+Statements; ComponentLink13URL: http://sigma.octopart.com:80/15684253/materials_sheet/ON-Semiconductor-NUP2105LT1G.csv?src-supplier=Compliance+Statements; ComponentLink13Description: http://sigma.octopart.com:80/15684253/materials_sheet/ON-Semiconductor-NUP2105LT1G.csv?src-supplier=Compliance+Statements; ComponentLink14URL: http://sigma.octopart.com:80/150629775/rohs_statement/ON-Semiconductor-NUP2105LT1G.pdf?src-supplier=Compliance+Statements; ComponentLink14Description: http://sigma.octopart.com:80/150629775/rohs_statement/ON-Semiconductor-NUP2105LT1G.pdf?src-supplier=Compliance+Statements; ComponentLink15URL: http://sigma.octopart.com:80/reach_statement/ON-Semiconductor-company-79.pdf?src-supplier=Compliance+Statements; ComponentLink15Description: http://sigma.octopart.com:80/reach_statement/ON-Semiconductor-company-79.pdf?src-supplier=Compliance+Statements; ComponentLink16URL: https://octopart.com:443/opatz8j6/c1?t=ZMQXRxl-tlOkTyCYWhiMSP0LPI36EMzxCu-rt4xVRkID6w1lkEqxXgfbyVHAv14EjzJQpMVrLm_GTNZmohIwKCbSQuhxgS4aaCOzuMZuzdtTNQjpOCOkObyoWTwnGitjD_aKANRAh2lPw-KtIiSN1C9a6qccJDCVrU3OyukjJjMVpNxQPGMvXs50OIMOtkcrM5shLr84_QV0TpV-tx49makq4PEa-F8ImDZxhjRMek526FA-FcjWLTSpNIusNfqu_3SnxPi4ucx5Ny24zrervKXbTtAk3aU33KfwhMqxTE9mwBLbd5ol23c2I0SDhKArEjQYMqXQ2s8XiDN6A3kYu5cM-5e4RY3v1HohIOej&src-supplier=Compliance+Statements; ComponentLink16Description: https://octopart.com:443/opatz8j6/c1?t=ZMQXRxl-tlOkTyCYWhiMSP0LPI36EMzxCu-rt4xVRkID6w1lkEqxXgfbyVHAv14EjzJQpMVrLm_GTNZmohIwKCbSQuhxgS4aaCOzuMZuzdtTNQjpOCOkObyoWTwnGitjD_aKANRAh2lPw-KtIiSN1C9a6qccJDCVrU3OyukjJjMVpNxQPGMvXs50OIMOtkcrM5shLr84_QV0TpV-tx49makq4PEa-F8ImDZxhjRMek526FA-FcjWLTSpNIusNfqu_3SnxPi4ucx5Ny24zrervKXbTtAk3aU33KfwhMqxTE9mwBLbd5ol23c2I0SDhKArEjQYMqXQ2s8XiDN6A3kYu5cM-5e4RY3v1HohIOej&src-supplier=Compliance+Statements; ComponentLink17URL: https://octopart.com:443/opatz8j6/c1?t=YAOrV0sMfXqVKWiE8k6dH1WclSlXB8gtlFWIwd4S7cYIeFCwgkBwbQJ5bWgsFHDi1PC-Qpb_Ct26CUG4UP-SQd806vdedNOA1AZ0mSUejaT1W15FwcKfZSqKtOg6OcLIZhGfUMXc4tA2cbQkgpIhx2KL7fZwcWhjVKDmOvUiltx43fdyMtIeSqzWtG30gLqCacBQFQmUjDNp97EetbhDXMa2NNxkO77MiJ1iJWdcIgpl2SLRAqm79JYpxIDHGLW2aimYKGEaixugE9-YzaQRB_J1_LvMpaZzYYa86eJBg1j47JCsO_PKNIbsx3s0tfo-1v4YqdsprCQBLNtzKj_wzUXjJuCrJvlRKr5GCqo&src-supplier=Compliance+Statements; ComponentLink17Description: https://octopart.com:443/opatz8j6/c1?t=YAOrV0sMfXqVKWiE8k6dH1WclSlXB8gtlFWIwd4S7cYIeFCwgkBwbQJ5bWgsFHDi1PC-Qpb_Ct26CUG4UP-SQd806vdedNOA1AZ0mSUejaT1W15FwcKfZSqKtOg6OcLIZhGfUMXc4tA2cbQkgpIhx2KL7fZwcWhjVKDmOvUiltx43fdyMtIeSqzWtG30gLqCacBQFQmUjDNp97EetbhDXMa2NNxkO77MiJ1iJWdcIgpl2SLRAqm79JYpxIDHGLW2aimYKGEaixugE9-YzaQRB_J1_LvMpaZzYYa86eJBg1j47JCsO_PKNIbsx3s0tfo-1v4YqdsprCQBLNtzKj_wzUXjJuCrJvlRKr5GCqo&src-supplier=Compliance+Statements
U1 = NORA-B120-00B: RF TXRX MOD BT /ANTU.FL SMD; Manufacturer: u-blox; Item Type: Module; Max Supply Voltage: 3.6V; Min Supply Voltage: 1.7V; Operating Supply Voltage: 3.3V; Supplier: Avnet; Supplier Part Number: NORA-B120-00B; Manufacturer Part Number: NORA-B120-00B; RoHS: Compliant; Stock: 500; Pricing: 500=11.22667, 1000=11.00654, 2000=10.85052, 4000=10.69886, 8000=10.525 (USD); Height - Seated (Max): 1.9mm; Length: 14.3mm; Lifecycle Status: Production; Max Operating Temperature: 105°C; Min Operating Temperature: -40°C; Number of Terminals: 82; Terminal Pitch: 1.1mm; Width: 10.4mm; ComponentLink1URL: https://datasheet.octopart.com:443/NORA-B120-00B-u-blox-datasheet-175595538.pdf?src-supplier=IHS; ComponentLink1Description: https://datasheet.octopart.com:443/NORA-B120-00B-u-blox-datasheet-175595538.pdf?src-supplier=IHS; ComponentLink2URL: https://datasheet.octopart.com:443/NORA-B120-00B-u-blox-datasheet-166811452.pdf?src-supplier=TME; ComponentLink2Description: https://datasheet.octopart.com:443/NORA-B120-00B-u-blox-datasheet-166811452.pdf?src-supplier=TME; ComponentLink3URL: https://datasheet.octopart.com:443/NORA-B120-00B-u-blox-datasheet-166532002.pdf?src-supplier=TME; ComponentLink3Description: https://datasheet.octopart.com:443/NORA-B120-00B-u-blox-datasheet-166532002.pdf?src-supplier=TME
U4 = SN74LV1T34DBVR: IC BUF NON-INVERT 5.5V SOT23-5; Manufacturer: Texas Instruments; Number of Elements: 1; Logic Function: Buffer,Inverting; High Level Output Current: -8mA; Low Level Output Current: 8mA; Min Supply Voltage: 1.6V; Polarity: Non-Inverting; Propagation Delay: 15.5ns; Quiescent Current: 1uA; Supplier 1: Digi-Key; Manufacturer Part Number: SN74LV1T34DBVR; Stock 1: 37360; Pricing 1: 1=0.43, 10=0.349, 25=0.3192, 100=0.2374, 250=0.2152, 500=0.17808, 1000=0.13356 (USD); Mount: Surface Mount; Case/Package: SOT-23-5; Number of Pins: 5; Weight: 0.000353oz; Min Operating Temperature: -40°C; Max Operating Temperature: 125°C; Packaging: Tape and Reel; Number of Bits per Element: 1; Number of Bits: 1; Package Quantity: 3000; Max Supply Voltage: 5.5V; Number of Input Lines: 1; Number of Output Lines: 1; Operating Supply Current: 8mA; Number of Channels: 1; Number of Inputs: 1; Number of Outputs: 1; Radiation Hardening: No; RoHS Compliant: Yes; REACH SVHC: No SVHC; Lead Free: Lead Free; ComponentLink1URL: http://www.ti.com/lit/pdf/sdyu001?src-supplier=Digi-Key; ComponentLink1Description: http://www.ti.com/lit/pdf/sdyu001?src-supplier=Digi-Key; ComponentLink2URL: http://www.ti.com/lit/ds/symlink/sn74lv1t34.pdf?src-supplier=Avnet; ComponentLink2Description: http://www.ti.com/lit/ds/symlink/sn74lv1t34.pdf?src-supplier=Avnet; Supplier Part Number 1: 296-37176-6-ND; LCSC Part Number: C100024; Item Type: IC

## Sheet Piezo_Regulator_Head_Power.SchDoc
size A2; SheetNumber: 2; SheetTotal: 2
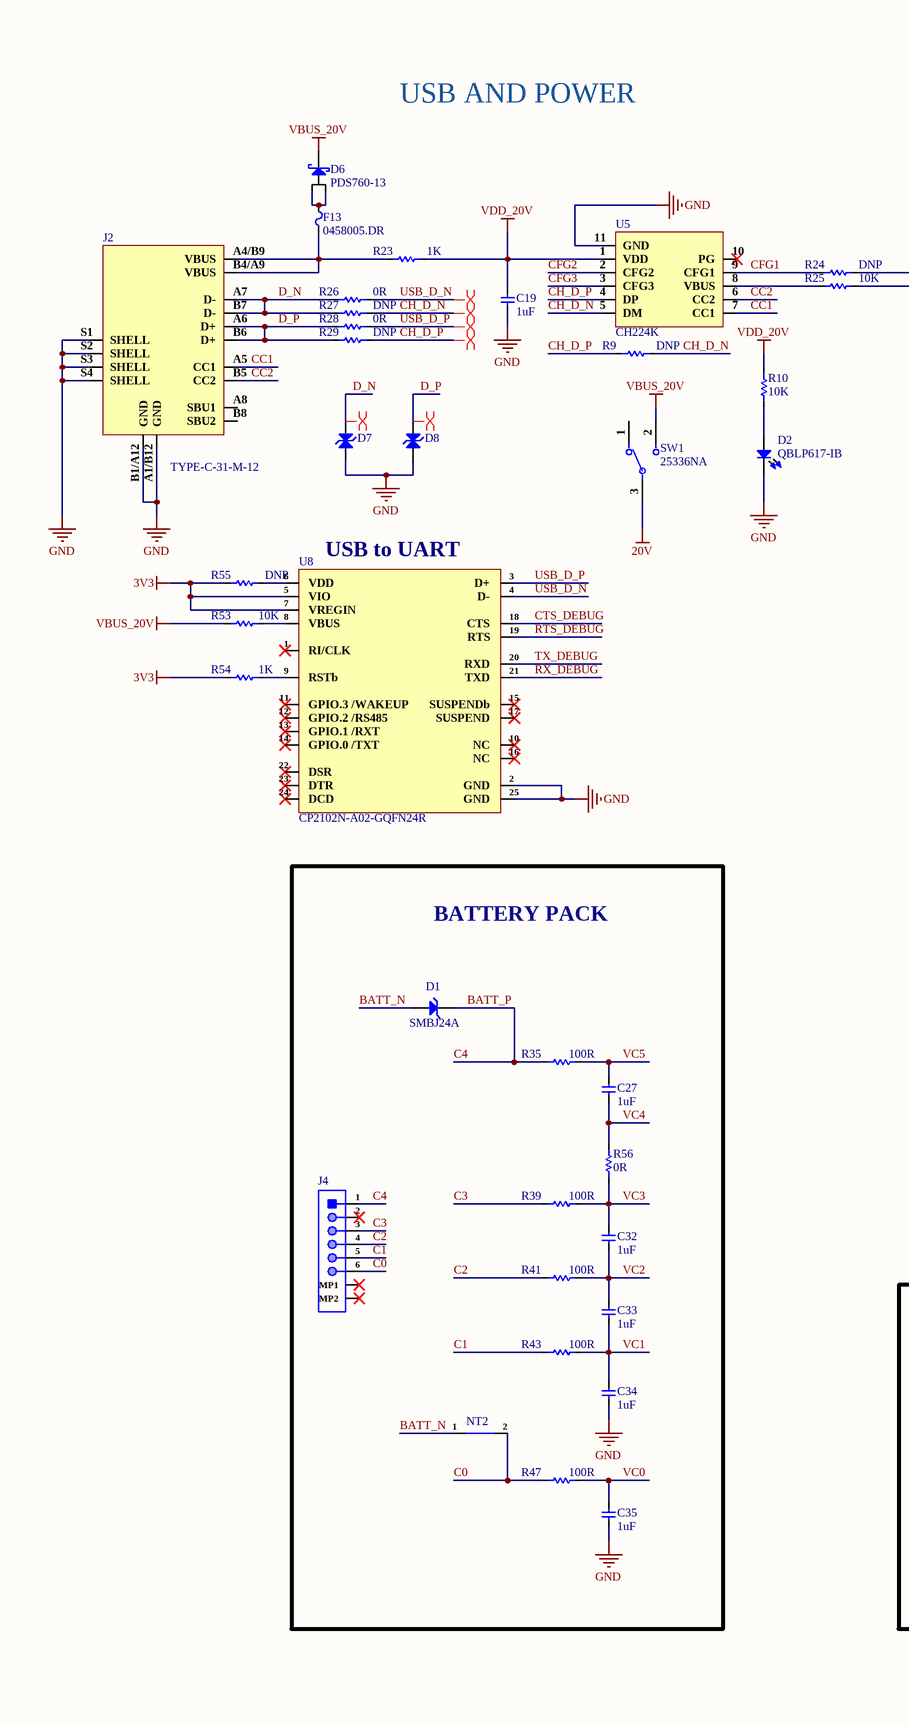
[diagram p1: Piezo_Regulator_Head_Power.SchDoc, left]
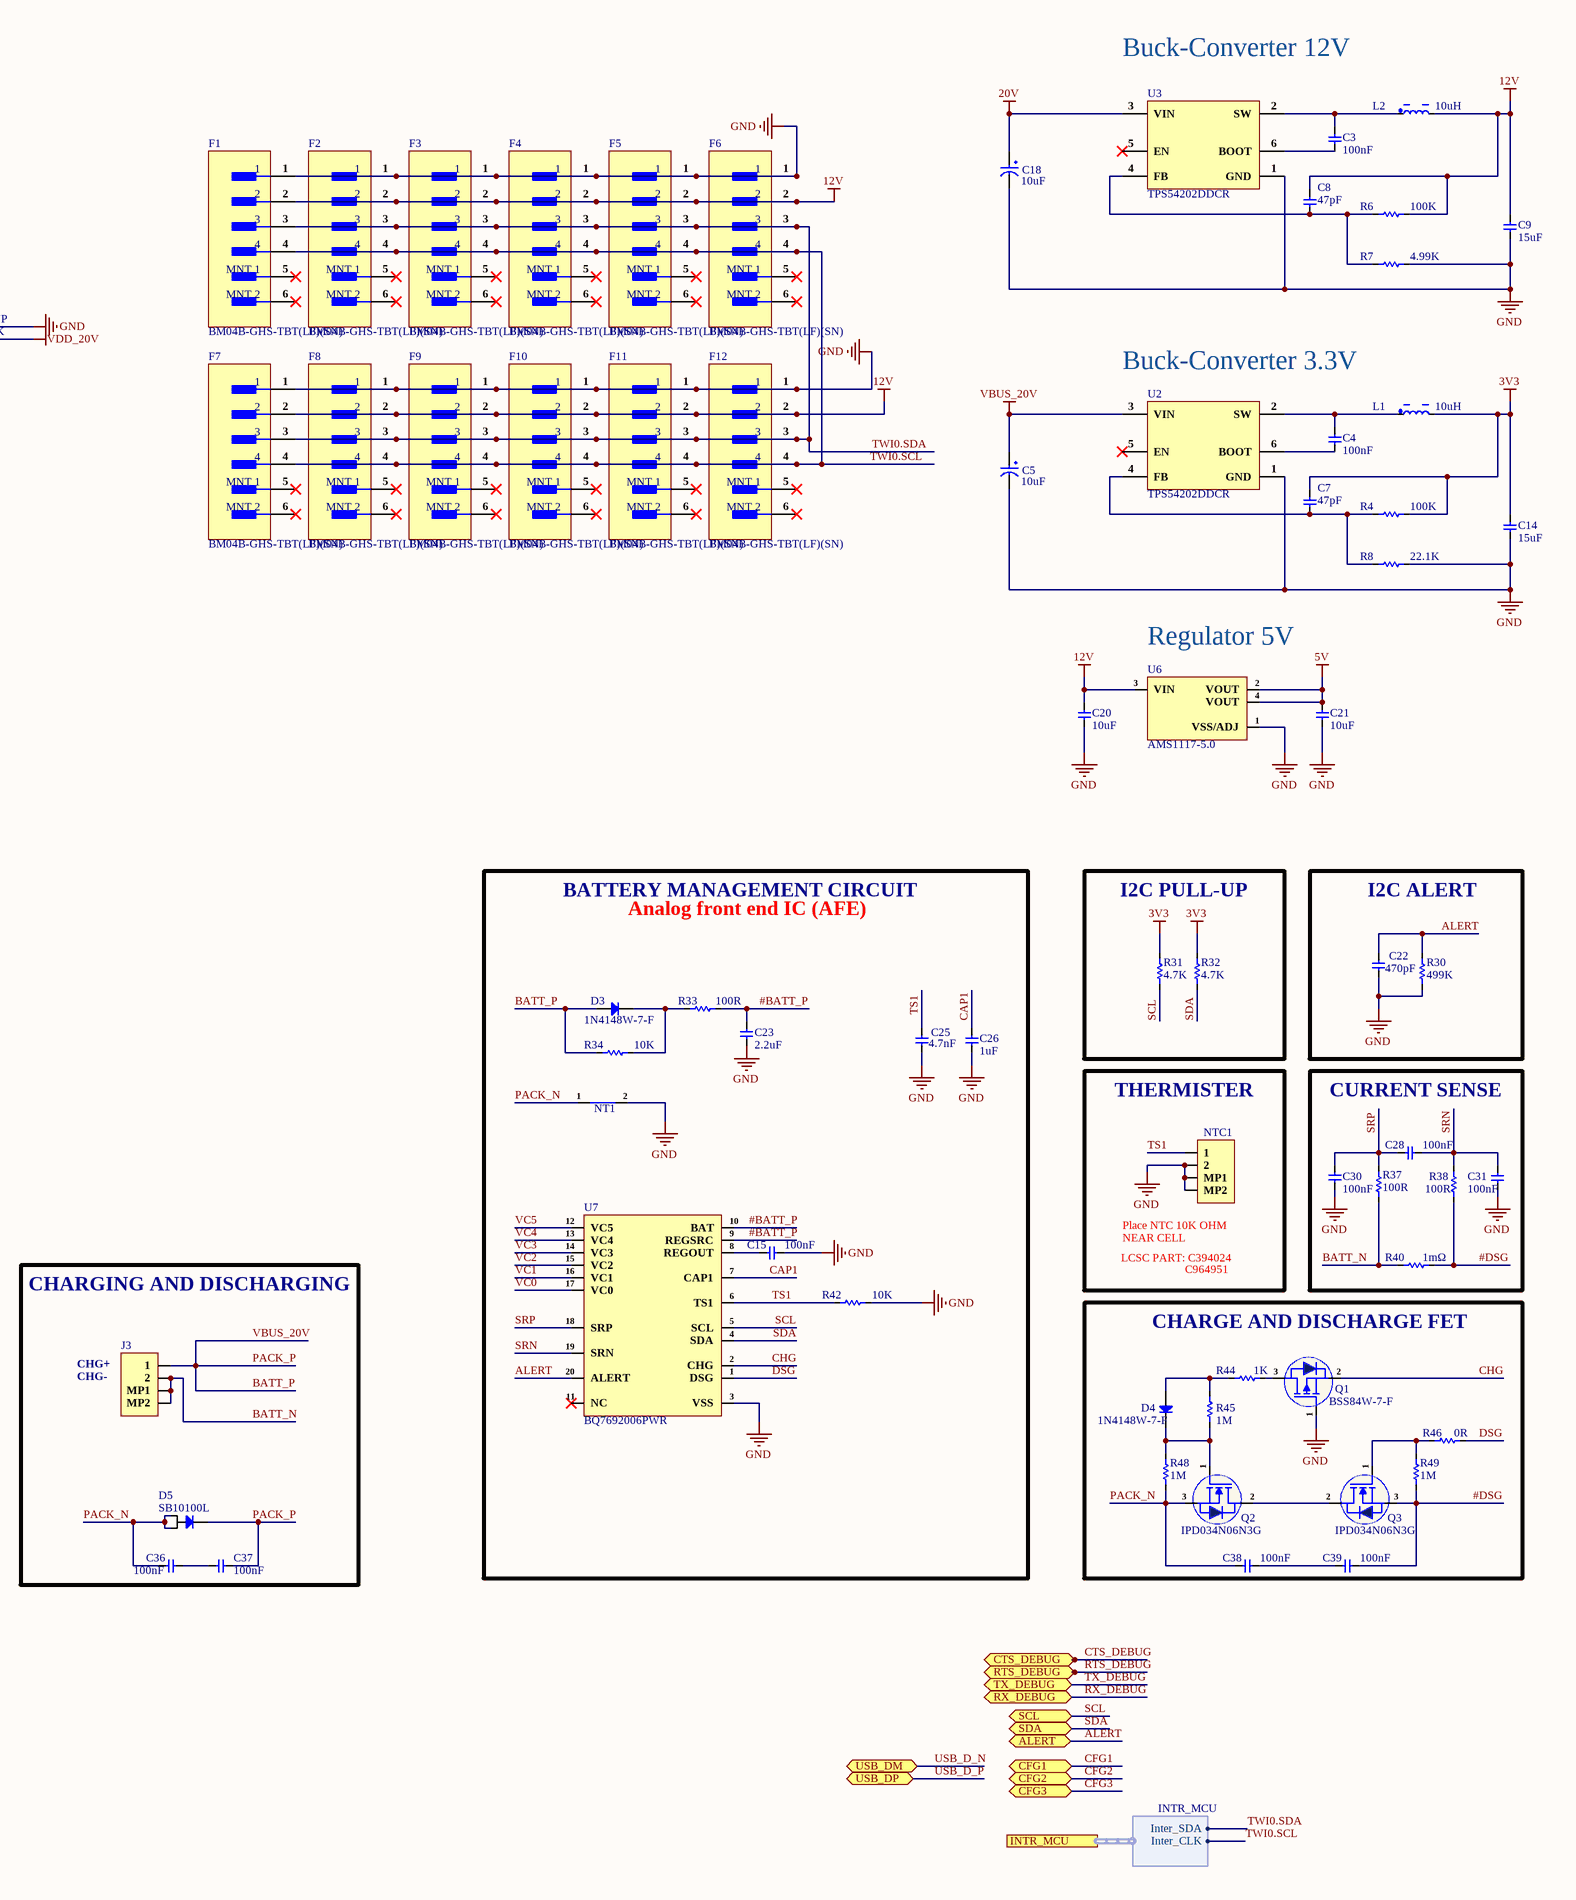
[diagram p2: Piezo_Regulator_Head_Power.SchDoc, right]

### Parts
C3  100nF  [Cap-0603]
C4  100nF  [Cap-0603]
C5  10uF  [Case-C]
C7  47pF  [Cap-0603]
C8  47pF  [Cap-0603]
C9  15uF  [Cap-1206]
C14  15uF  [Cap-1206]
C15  100nF  [Cap-0603]
C18  10uF  [Case-C]
C19  1uF  [Cap-0805]
C20  10uF  [Cap-0603]
C21  10uF  [Cap-0603]
C22  470pF  [Cap-0603]
C23  2.2uF  [Cap-0805]
C25  4.7nF  [Cap-0603]
C26  1uF  [Cap-0603]
C27  1uF  [Cap-0603]
C28  100nF  [Cap-0603]
C30  100nF  [Cap-0603]
C31  100nF  [Cap-0603]
C32  1uF  [Cap-0603]
C33  1uF  [Cap-0603]
C34  1uF  [Cap-0603]
C35  1uF  [Cap-0603]
C36  100nF  [Cap-0603]
C37  100nF  [Cap-0603]
C38  100nF  [Cap-0603]
C39  100nF  [Cap-0603]
D1  SMBJ24A  [SMB_]
D2  QBLP617-IB  [LED-0603]
D3  1N4148W-7-F  [SOD-123]
D4  1N4148W-7-F  [SOD-123]
D5  SB10100L  [SB10100L]
D6  PDS760-13  [Power-DI-5]
D7  ESD5B5.0ST1G  [SOD-523 (Bi-Directional)]  (value not drawn)
D8  ESD5B5.0ST1G  [SOD-523 (Bi-Directional)]  (value not drawn)
F1  BM04B-GHS-TBT(LF)(SN)  [BM04B-GHS-TBT]
F2  BM04B-GHS-TBT(LF)(SN)  [BM04B-GHS-TBT]
F3  BM04B-GHS-TBT(LF)(SN)  [BM04B-GHS-TBT]
F4  BM04B-GHS-TBT(LF)(SN)  [BM04B-GHS-TBT]
F5  BM04B-GHS-TBT(LF)(SN)  [BM04B-GHS-TBT]
F6  BM04B-GHS-TBT(LF)(SN)  [BM04B-GHS-TBT]
F7  BM04B-GHS-TBT(LF)(SN)  [BM04B-GHS-TBT]
F8  BM04B-GHS-TBT(LF)(SN)  [BM04B-GHS-TBT]
F9  BM04B-GHS-TBT(LF)(SN)  [BM04B-GHS-TBT]
F10  BM04B-GHS-TBT(LF)(SN)  [BM04B-GHS-TBT]
F11  BM04B-GHS-TBT(LF)(SN)  [BM04B-GHS-TBT]
F12  BM04B-GHS-TBT(LF)(SN)  [BM04B-GHS-TBT]
F13  0458005.DR  [Fuse 1206 (3216 Metric)]
J2  TYPE-C-31-M-12  [TYPE-C-31-M-12_]
J3  WAFER-PH2.0-2PWB  [WAFER-PH2.0-2PWB]  (value not drawn)
J4  S6B-PH-SM4-TB(LF)(SN)  [S6B-PH-SM4-TB(LF)(SN)]  (value not drawn)
L1  10uH  [78438357100]
L2  10uH  [78438357100]
NT1  Net Tie_SMD  [Net Tie Pad]  (value not drawn)  (net tie, no BOM)
NT2  Net Tie_SMD  [Net Tie Pad]  (value not drawn)  (net tie, no BOM)
NTC1  WAFER-PH2.0-2PWB  [WAFER-PH2.0-2PWB]  (value not drawn)
Q1  BSS84W-7-F  [SOT-323]
Q2  IPD034N06N3G  [TO-252-2L]  (value not drawn)
Q3  IPD034N06N3G  [TO-252-2L]  (value not drawn)
R4  100K  [Res-0603]
R6  100K  [Res-0603]
R7  4.99K  [Res-0603]
R8  22.1K  [Res-0603]
R9  DNP  [Res-0603]
R10  10K  [Res-0603]
R23  1K  [Res-0603]
R24  DNP  [Res-0603]
R25  10K  [Res-0603]
R26  0R  [Res-0603]
R27  DNP  [Res-0603]
R28  0R  [Res-0603]
R29  DNP  [Res-0603]
R30  499K  [Res-0603]
R31  4.7K  [Res-0603]
R32  4.7K  [Res-0603]
R33  100R  [RES-0805]
R34  10K  [Res-0603]
R35  100R  [RES-0805]
R37  100R  [RES-0805]
R38  100R  [RES-0805]
R39  100R  [RES-0805]
R40  1mΩ  [RES 3920]
R41  100R  [RES-0805]
R42  10K  [Res-0603]
R43  100R  [RES-0805]
R44  1K  [RES-0805]
R45  1M  [RES-0805]
R46  0R  [Res-0805]
R47  100R  [RES-0805]
R48  1M  [RES-0805]
R49  1M  [RES-0805]
R53  10K  [Res-0603]
R54  1K  [Res-0603]
R55  DNP  [Res-0603]
R56  0R  [Res-0603]
SW1  25336NA  [25336NA]
U2  TPS54202DDCR  [SOT-23-6 THIN]
U3  TPS54202DDCR  [SOT-23-6 THIN]
U5  CH224K  [ESSOP-10-150mil-1mm]
U6  AMS1117-5.0  [SOT- 223]
U7  BQ7692006PWR  [TSSOP-20]
U8  CP2102N-A02-GQFN24R  [24-WQFN (4x4)]

### Blocks framed on the sheet
BATTERY PACK: C27 C32-C35 D1 J4 NT2 R35 R39 R41 R43 R47 R56
I2C PULL-UP: R31 R32
I2C ALERT: C22 R30
THERMISTER: NTC1
CURRENT SENSE: C28 C30 C31 R37 R38 R40
CHARGING AND DISCHARGING: C36 C37 D5 J3
CHARGE AND DISCHARGE FET: C38 C39 D4 Q1-Q3 R44-R46 R48 R49

### Ports
ALERT (bidir, see Piezo_Regulator_Head_MCU[1D]), CFG1 (bidir, see Piezo_Regulator_Head_MCU[1D]), CFG2 (bidir, see Piezo_Regulator_Head_MCU[1D]), CFG3 (bidir, see Piezo_Regulator_Head_MCU[1D]), CTS_DEBUG (bidir, see Piezo_Regulator_Head_MCU[1C]), INTR_MCU (harness INTR_MCU, see Piezo_Regulator_Head_MCU[1C]), RTS_DEBUG (bidir, see Piezo_Regulator_Head_MCU[1C]), RX_DEBUG (bidir, see Piezo_Regulator_Head_MCU[1C]), SCL (bidir, see Piezo_Regulator_Head_MCU[1D]), SDA (bidir, see Piezo_Regulator_Head_MCU[1D]), TX_DEBUG (bidir, see Piezo_Regulator_Head_MCU[1C]), USB_DM (bidir, see Piezo_Regulator_Head_MCU[1D]), USB_DP (bidir, see Piezo_Regulator_Head_MCU[1D])

### Harnesses
INTR_MCU: Inter_SDA, Inter_CLK

### Nets
3V3: C7.2 C14.2 L1.2 R4.2 R31.2 R32.2 R54.1 R55.1 U8.5(VIO) U8.7(VREGIN)
5V: C21.2 U6.2(VOUT) U6.4(VOUT)
12V: C8.2 C9.2 C20.2 F1.2 F2.2 F3.2 F4.2 F5.2 F6.2 F7.2 F8.2 F9.2 F10.2 F11.2 F12.2 L2.2 R6.2 U6.3(VIN)
20V: C18.1 SW1.3(Common) U3.3(VIN)
BATT_P: C5.1 C37.1 D1.2(K) D3.1(A) D5.3(K) D6.3(K) J3.1 J4.1 R34.2 R35.1 R53.1 SW1.2 U2.3(VIN)  [also labelled C4, PACK_P, VBUS_20V]
GND: C5.2 C9.1 C14.1 C15.1 C18.2 C19.1 C20.1 C21.1 C22.1 C23.1 C25.1 C26.1 C30.2 C31.1 C34.1 C35.1 D2.2 D7.1(A) D8.1(A) F1.1 F2.1 F3.1 F4.1 F5.1 F6.1 F7.1 F8.1 F9.1 F10.1 F11.1 F12.1 J2.A1/B12(GND) J2.B1/A12(GND) J2.S1(SHELL) J2.S2(SHELL) J2.S3(SHELL) J2.S4(SHELL) NT1.2 NTC1.2 NTC1.MP1 NTC1.MP2 Q1.1(G) R7.2 R8.2 R24.2 R30.1 R42.1 U2.1(GND) U3.1(GND) U5.11(GND) U6.1(VSS/ADJ) U7.3(VSS) U8.2(GND) U8.25(GND)
VDD_20V: C19.2 R10.2 R23.2 R25.2 U5.1(VDD)
#BATT_P: C23.2 R33.2 U7.9(REGSRC) U7.10(BAT)
#DSG: C39.1 Q3.3(S) R38.1 R40.2 R49.1
ALERT: C22.2 R30.2 U7.20(ALERT) ; port ALERT
BATT_N: D1.1(A) J3.2 J3.MP1 J3.MP2 NT2.1 R37.1 R40.1
C0: J4.6 NT2.2 R47.1
C1: J4.5 R43.1
C2: J4.4 R41.1
C3: J4.3 R39.1
CAP1: C26.2 U7.7(CAP1)
CC1: J2.A5(CC1) U5.7(CC1)
CC2: J2.B5(CC2) U5.6(CC2)
CFG1: R24.1 U5.9(CFG1) ; port CFG1
CFG2: U5.2(CFG2) ; port CFG2
CFG3: U5.3(CFG3) ; port CFG3
CH_D_N: R9.2 R27.2 U5.5(DM)
CH_D_P: R9.1 R29.2 U5.4(DP)
CHG: Q1.2(S) U7.2(CHG)
CTS_DEBUG: U8.18(CTS) ; port CTS_DEBUG
D_N: D7.2(A) J2.A7(D-) J2.B7(D-) R26.1 R27.1
D_P: D8.2(A) J2.A6(D+) J2.B6(D+) R28.1 R29.1
DSG: R46.1 U7.1(DSG)
PACK_N: C36.2 C38.2 D5.1(A) D5.2(A) NT1.1 Q2.3(S) R48.1
RTS_DEBUG: U8.19(RTS) ; port RTS_DEBUG
RX_DEBUG: U8.21(TXD) ; port RX_DEBUG
SCL: R31.1 U7.5(SCL) ; port SCL
SDA: R32.1 U7.4(SDA) ; port SDA
SRN: C28.1 C31.2 R38.2 U7.19(SRN)
SRP: C28.2 C30.1 R37.2 U7.18(SRP)
TS1: C25.2 NTC1.1 R42.2 U7.6(TS1)
TWI0.SCL: F1.4 F2.4 F3.4 F4.4 F5.4 F6.4 F7.4 F8.4 F9.4 F10.4 F11.4 F12.4 ; port INTR_MCU.Inter_CLK
TWI0.SDA: F1.3 F2.3 F3.3 F4.3 F5.3 F6.3 F7.3 F8.3 F9.3 F10.3 F11.3 F12.3 ; port INTR_MCU.Inter_SDA
TX_DEBUG: U8.20(RXD) ; port TX_DEBUG
USB_D_N: R26.2 U8.4(D-) ; port USB_DM
USB_D_P: R28.2 U8.3(D+) ; port USB_DP
VC0: C35.2 R47.2 U7.17(VC0)
VC1: C33.1 C34.2 R43.2 U7.16(VC1)
VC2: C32.1 C33.2 R41.2 U7.15(VC2)
VC3: C32.2 R39.2 R56.1 U7.14(VC3)
VC4: C27.1 R56.2 U7.13(VC4)
VC5: C27.2 R35.2 U7.12(VC5)
NetC3_1: C3.1 U3.6(BOOT)
NetC3_2: C3.2 L2.1 U3.2(SW)
NetC4_1: C4.1 U2.6(BOOT)
NetC4_2: C4.2 L1.1 U2.2(SW)
NetC7_1: C7.1 R4.1 R8.1 U2.4(FB)
NetC8_1: C8.1 R6.1 R7.1 U3.4(FB)
NetC15_2: C15.2 U7.8(REGOUT)
NetC36_1: C36.1 C37.2
NetC38_1: C38.1 C39.2
NetD2_1: D2.1 R10.1
NetD3_2: D3.2(K) R33.1 R34.1
NetD4_1: D4.1(A) R44.1 R45.2
NetD4_2: D4.2(K) Q2.1(G) R45.1 R48.2
NetD6_1: D6.1(A) D6.2(A) F13.2
NetF13_1: F13.1 J2.A4/B9(VBUS) J2.B4/A9(VBUS) R23.1
NetQ1_3: Q1.3(D) R44.2
NetQ2_2: Q2.2(D) Q3.2(D)
NetQ3_1: Q3.1(G) R46.2 R49.2
NetR25_1: R25.1 U5.8(VBUS)
NetR53_2: R53.2 U8.8(VBUS)
NetR54_2: R54.2 U8.9(RSTb)
NetR55_2: R55.2 U8.6(VDD)

Not connected (* = marked no-connect by the designer): F1 5(MNT_1)* 6(MNT_2)*; F2 5(MNT_1)* 6(MNT_2)*; F3 5(MNT_1)* 6(MNT_2)*; F4 5(MNT_1)* 6(MNT_2)*; F5 5(MNT_1)* 6(MNT_2)*; F6 5(MNT_1)* 6(MNT_2)*; F7 5(MNT_1)* 6(MNT_2)*; F8 5(MNT_1)* 6(MNT_2)*; F9 5(MNT_1)* 6(MNT_2)*; F10 5(MNT_1)* 6(MNT_2)*; F11 5(MNT_1)* 6(MNT_2)*; F12 5(MNT_1)* 6(MNT_2)*; J2 A8(SBU1) B8(SBU2); J4 2* MP1* MP2*; SW1 1; U2 5(EN)*; U3 5(EN)*; U5 10(PG)*; U7 11(NC)*; U8 1(RI/CLK)* 10(NC)* 11(GPIO.3_/WAKEUP)* 12(GPIO.2_/RS485)* 13(GPIO.1_/RXT)* 14(GPIO.0_/TXT)* 15(SUSPENDb)* 16(NC)* 17(SUSPEND)* 22(DSR)* 23(DTR)* 24(DCD)*

### Layout directives
differential pair: D_N, D_P
differential pair; differential pair class D1_Lines; net class D1: USB_D_N
differential pair; net class D1; differential pair class D1_Lines: CH_D_N, CH_D_P, USB_D_P